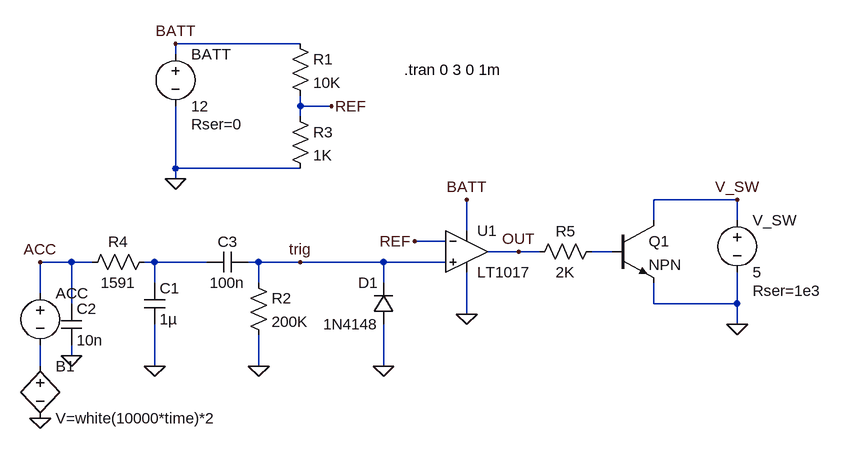
[diagram p0: schematic pi_on_switch_trig_circuit.asc]
pi_on_switch_trig_circuit.asc, the LTspice schematic file:
Version 4.1
SHEET 1 880 680
WIRE -240 -272 -432 -272
WIRE -432 -256 -432 -272
WIRE -240 -176 -240 -192
WIRE -192 -176 -240 -176
WIRE -240 -160 -240 -176
WIRE -432 -80 -432 -176
WIRE -240 -80 -432 -80
WIRE -432 -64 -432 -80
WIRE 432 -32 304 -32
WIRE 304 0 304 -32
WIRE 432 0 432 -32
WIRE 16 16 16 -32
WIRE -16 32 -64 32
WIRE 96 48 48 48
WIRE 128 48 96 48
WIRE 240 48 208 48
WIRE -592 64 -640 64
WIRE -560 64 -592 64
WIRE -464 64 -480 64
WIRE -384 64 -464 64
WIRE -304 64 -320 64
WIRE -240 64 -304 64
WIRE -112 64 -240 64
WIRE -16 64 -112 64
WIRE -464 96 -464 64
WIRE -304 96 -304 64
WIRE -112 96 -112 64
WIRE -640 112 -640 64
WIRE -592 128 -592 64
WIRE 304 128 304 96
WIRE 432 128 432 80
WIRE 432 128 304 128
WIRE 16 144 16 80
WIRE 432 160 432 128
WIRE -592 208 -592 192
WIRE -640 224 -640 192
WIRE -464 224 -464 160
WIRE -304 224 -304 176
WIRE -112 224 -112 160
FLAG -240 64 trig
FLAG -432 -64 0
FLAG -432 -272 BATT
FLAG -112 224 0
FLAG -304 224 0
FLAG -640 64 ACC
FLAG 16 -32 BATT
FLAG 16 144 0
FLAG 96 48 OUT
FLAG -192 -176 REF
FLAG -64 32 REF
FLAG -464 224 0
FLAG 432 -32 V_SW
FLAG 432 160 0
FLAG -640 304 0
FLAG -592 208 0
SYMBOL voltage -432 -272 R0
WINDOW 123 0 0 Left 0
WINDOW 39 24 124 Left 2
SYMATTR SpiceLine Rser=0
SYMATTR InstName BATT
SYMATTR Value 12
SYMBOL voltage -640 96 R0
WINDOW 3 -339 49 Invisible 2
WINDOW 123 0 0 Left 0
WINDOW 39 0 0 Left 0
SYMATTR Value PULSE(0 12 0.5 1m 1m 1m 2 8)
SYMATTR InstName ACC
SYMBOL cap -320 48 R90
WINDOW 0 0 32 VBottom 2
WINDOW 3 32 32 VTop 2
SYMATTR InstName C3
SYMATTR Value 100n
SYMBOL res -320 80 R0
SYMATTR InstName R2
SYMATTR Value 200K
SYMBOL diode -96 160 R180
WINDOW 0 24 64 Left 2
WINDOW 3 24 0 Left 2
SYMATTR InstName D1
SYMATTR Value 1N4148
SYMBOL Comparators\\LT1017 16 48 R0
SYMATTR InstName U1
SYMBOL res -256 -288 R0
SYMATTR InstName R1
SYMATTR Value 10K
SYMBOL res -256 -176 R0
SYMATTR InstName R3
SYMATTR Value 1K
SYMBOL cap -480 96 R0
SYMATTR InstName C1
SYMATTR Value 1µ
SYMBOL res -464 48 R90
WINDOW 0 0 56 VBottom 2
WINDOW 3 32 56 VTop 2
SYMATTR InstName R4
SYMATTR Value 1591
SYMBOL npn 240 0 R0
SYMATTR InstName Q1
SYMBOL voltage 432 -16 R0
WINDOW 123 0 0 Left 0
WINDOW 39 24 124 Left 2
SYMATTR SpiceLine Rser=1e3
SYMATTR InstName V_SW
SYMATTR Value 5
SYMBOL res 224 32 R90
WINDOW 0 0 56 VBottom 2
WINDOW 3 32 56 VTop 2
SYMATTR InstName R5
SYMATTR Value 2K
SYMBOL cap -608 128 R0
SYMATTR InstName C2
SYMATTR Value 10n
SYMBOL bv -640 208 R0
SYMATTR InstName B1
SYMATTR Value V=white(10000*time)*2
TEXT -80 -232 Left 2 !.tran 0 3 0 1m

The netlist it stands for:
* pi_on_switch_trig_circuit.asc
V§BATT BATT 0 12 Rser=0
V§ACC ACC N003 PULSE(0 12 0.5 1m 1m 1m 2 8)
C3 trig N002 100n
R2 trig 0 200K
D1 0 trig 1N4148
X§U1 trig REF BATT 0 OUT LT1017  ; pins In+ In- V+ V- OUT
R1 BATT REF 10K
R3 REF 0 1K
C1 N002 0 1µ
R4 N002 ACC 1591
Q1 V_SW N001 0 0 NPN
V_SW V_SW 0 5 Rser=1e3
R5 N001 OUT 2K
C2 ACC 0 10n
B1 N003 0 V=white(10000*time)*2
.model D D
.lib standard.dio
.model NPN NPN
.model PNP PNP
.lib standard.bjt
.tran 0 3 0 1m
.backanno
.end